# Altium schematic sheet USB.SchDoc
size A4; SheetNumber: 1; SheetTotal: 2
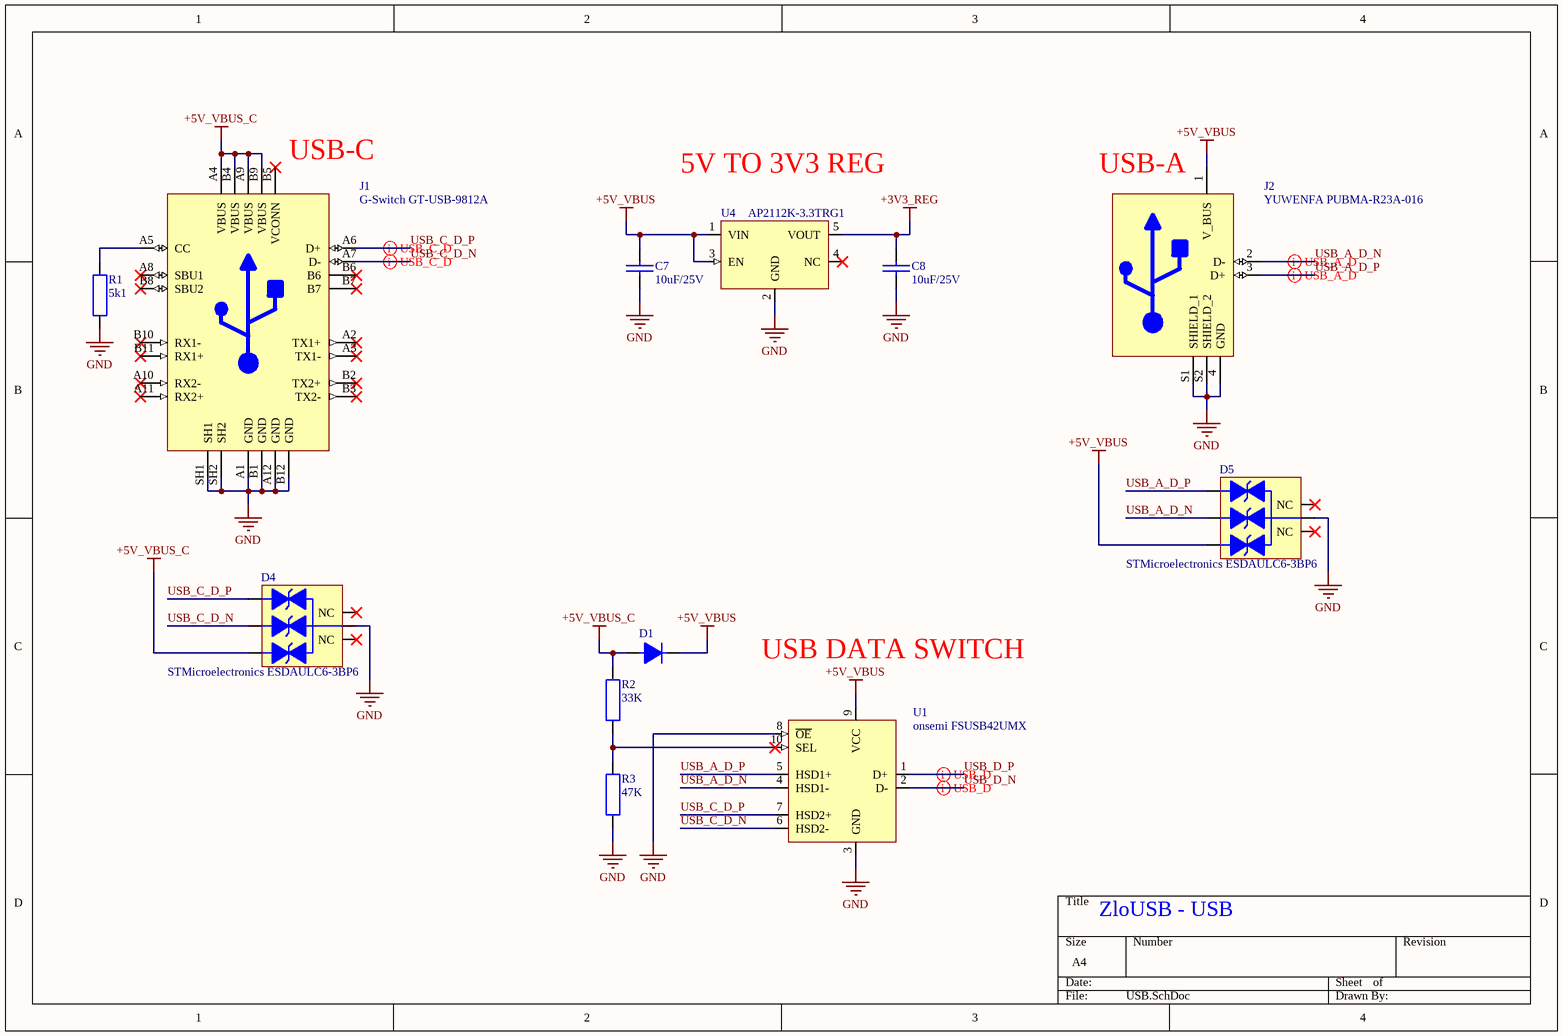
[diagram p0: USB.SchDoc]

## Parts
C7  10uF/25V  [CAPC2012X95N]
C8  10uF/25V  [CAPC2012X95N]
D1  Guangdong Hottech 1N5819WS  [SODFL250130X100N]  (value not drawn)
D4  STMicroelectronics ESDAULC6-3BP6  [STMicroelectronics ESDAULC6-3BP6]
D5  STMicroelectronics ESDAULC6-3BP6  [STMicroelectronics ESDAULC6-3BP6]
J1  G-Switch GT-USB-9812A  [G-Switch GT-USB-9812A]
J2  YUWENFA PUBMA-R23A-016  [YUWENFA PUBMA-R23A-016]
R1  5k1  [RESC1005X40N]
R2  33K  [RESC1005X40N]
R3  47K  [RESC1005X40N]
U1  onsemi FSUSB42UMX  [onsemi FSUSB42UMX]
U4  AP2112K-3.3TRG1  [SOT95P285X140-5N]

## Nets
+3V3_REG: C8.2 U4.5(VOUT)
+5V_VBUS: C7.2 D1.1 D5.4(IO/3) J2.1(V_BUS) U1.9(VCC) U4.1(VIN) U4.3(EN)
+5V_VBUS_C: D1.2 D4.4(IO/3) J1.A4(VBUS) J1.A9(VBUS) J1.B4(VBUS) J1.B9(VBUS) R2.2
GND: C7.1 C8.1 D4.6(GND) D5.6(GND) J1.A1(GND) J1.A12(GND) J1.B1(GND) J1.B12(GND) J1.SH1 J1.SH2 J2.4(GND) J2.S1(SHIELD_1) J2.S2(SHIELD_2) R1.1 R3.1 U1.3(GND) U1.8(~{OE}) U4.2(GND)
USB_A_D_N: D5.3(I/O2) J2.2(D-) U1.4(HSD1-)
USB_A_D_P: D5.1(I/O1) J2.3(D+) U1.5(HSD1+)
USB_C_D_N: D4.3(I/O2) J1.A7(D-) U1.6(HSD2-)
USB_C_D_P: D4.1(I/O1) J1.A6(D+) U1.7(HSD2+)
USB_D_N: U1.2(D-)
USB_D_P: U1.1(D+)
NetJ1_A5: J1.A5(CC) R1.2
NetR2_1: R2.1 R3.2 U1.10(SEL)

Not connected (* = marked no-connect by the designer): D4 2(NC)* 5(NC)*; D5 2(NC)* 5(NC)*; J1 A2(TX1+)* A3(TX1-)* A8(SBU1)* A10(RX2-)* A11(RX2+)* B2(TX2+)* B3(TX2-)* B5(VCONN)* B6* B7* B8(SBU2)* B10(RX1-)* B11(RX1+)*; U4 4(NC)*

## Layout directives
differential pair: USB_A_D_N, USB_A_D_P, USB_C_D_N, USB_C_D_P, USB_D_N, USB_D_P

## Notes on the sheet
- (near J1) USB-C
- 5V TO 3V3 REG
- (near J2) USB-A
- USB DATA SWITCH
- ZloUSB - USB

## Library data of the parts
C7 C8 = Samsung Electro-Mechanics CL21B106KAYQNNE: CAP CER 10uF 25V X7R 0805; Manufacturer Part Number: CL21B106KAYQNNE; ComponentLink1Description: Datasheet; ComponentLink1URL: https://mm.digikey.com/Volume0/opasdata/d220001/medias/docus/7851/1276_CL21B1.pdf; Manufacturer: Samsung Electro-Mechanics; LCSC Part #: C3039694; Supplier 1: LCSC; Supplier Part Number 1: C3039694; JLCPCB Parts Type: Extended; JLCPCB PCBA Type: Economic and Standard
D1 = Guangdong Hottech 1N5819WS: DIODE SCHOTTKY 40V SOD-323; Manufacturer Part Number: 1N5819WS; ComponentLink1Description: Datasheet; ComponentLink1URL: https://www.lcsc.com/datasheet/C191023.pdf?spm=wm.sxq.inf.ggs&lcsc_vid=FgUKAwAHT1hdAgBSEQJZUFZfRwdWX1BXQgcMVwVSEgcxVlNeQ1dbV11VRlhXXzsOAxUeFF5JWBYZEEoKFBINSQcJGk4%3D; Manufacturer: Guangdong Hottech; ComponentLink2Description: 3D Model Source; ComponentLink2URL: *; JLCPCB Parts Type: Basic; JLCPCB PCBA Type: Economic and Standard; Supplier 1: LCSC; Supplier Part Number 1: C191023; LCSC Part #: C191023
D4 D5 = STMicroelectronics ESDAULC6-3BP6: TVS DIODE 5VWM SOT666; Manufacturer Part Number: ESDAULC6-3BP6; ComponentLink1Description: Datasheet; ComponentLink1URL: https://www.st.com/resource/en/datasheet/cd00165276.pdf; Manufacturer: STMicroelectronics; ComponentLink2Description: 3D Model Source; ComponentLink2URL: *; JLCPCB Parts Type: Extended; JLCPCB PCBA Type: Economic and Standard; LCSC Part #: C1976755
J1 = G-Switch GT-USB-9812A: USB 3.1 SMD USB, DVI, HDMI Connector Adapters RoHS; Manufacturer Part Number: GT-USB-9812A; ComponentLink1Description: Datasheet; ComponentLink1URL: https://www.lcsc.com/datasheet/C53055684.pdf?spm=wm.sxq.inf.ggs&lcsc_vid=QFhdBFUAE1JXUFRfFQQLUV0CQlRcUV0CRAJZXwEFRlYxVlNeQ1leUVJRT1lcVTsOAxUeFF5JWBYZEEoKFBINSQcJGk4%3D; Manufacturer: G-Switch; ComponentLink2Description: 3D Model Source; ComponentLink2URL: *; JLCPCB Parts Type: Extended; JLCPCB PCBA Type: Economic and Standard; LCSC Part #: C53055684
J2 = YUWENFA PUBMA-R23A-016: -25℃~+85℃ 0.95mm 1 1,500 Cycles 1.5A 18.8mm 30V 4P Male Recessed Type-A USB 2.0 White With Locating Pins Plugin USB Connectors ROHS; Manufacturer Part Number: PUBMA-R23A-016; ComponentLink1Description: Datasheet; ComponentLink1URL: https://www.lcsc.com/datasheet/C55061488.pdf; Manufacturer: YUWENFA; LCSC Part #: C55061488; ComponentLink2Description: 3D Model Source; ComponentLink2URL: *; JLCPCB Parts Type: Extended; JLCPCB PCBA Type: Economic and Standard
R1 = UNI-ROYAL 0402WGF5101TCE: RES 5.1kΩ ±1% 62.5mW 0402; Manufacturer Part Number: 0402WGF5101TCE; ComponentLink1Description: Datasheet; ComponentLink1URL: https://www.lcsc.com/datasheet/C25905.pdf?spm=wm.sxq.inf.ggs&lcsc_vid=QwRWVlFeFgUPVwAHRlQMVFRWElEIXlYDQFlcUQdRRFYxVlNeRVdaVFZVRFRdXzsOAxUeFF5JWBYZEEoKFBINSQcJGk4%3D; Manufacturer: UNI-ROYAL; ComponentLink2Description: 3D Model Source; ComponentLink2URL: *; JLCPCB Parts Type: Basic; JLCPCB PCBA Type: Economic and Standard; LCSC Part #: C25905
R2 = UNI-ROYAL 0402WGF3302TCE: RES 33kΩ ±1% 62.5mW 0402; Manufacturer Part Number: 0402WGF3302TCE; ComponentLink1Description: Datasheet; ComponentLink1URL: https://www.lcsc.com/datasheet/C25779.pdf?spm=wm.sxq.inf.ggs&lcsc_vid=FgUKAwAHT1hdAgBSEQJZUFZfRwdWX1BXQgcMVwVSEgcxVlNeQ1dbVVBSRVJXVzsOAxUeFF5JWBYZEEoKFBINSQcJGk4%3D; Manufacturer: UNI-ROYAL; ComponentLink2Description: 3D Model Source; ComponentLink2URL: *; JLCPCB Parts Type: Basic; JLCPCB PCBA Type: Economic and Standard; LCSC Part #: C25779
R3 = UNI-ROYAL 0402WGF4702TCE: RES 47kΩ ±1% 62.5mW 0402; Manufacturer Part Number: 0402WGF4702TCE; ComponentLink1Description: Datasheet; ComponentLink1URL: https://www.lcsc.com/datasheet/C25792.pdf?spm=wm.sxq.inf.ggs&lcsc_vid=FgUKAwAHT1hdAgBSEQJZUFZfRwdWX1BXQgcMVwVSEgcxVlNeQ1dbVVFURVhdVTsOAxUeFF5JWBYZEEoKFBINSQcJGk4eFQsCAgIaSgADAwAHC0slRVRZUF1IHxUDCw%3D%3D; Manufacturer: UNI-ROYAL; ComponentLink2Description: 3D Model Source; ComponentLink2URL: *; JLCPCB Parts Type: Basic; JLCPCB PCBA Type: Economic and Standard; LCSC Part #: C25792
U1 = onsemi FSUSB42UMX: IC USB SWITCH DPDT 10UMLP; Manufacturer Part Number: FSUSB42UMX; ComponentLink1Description: Datasheet; ComponentLink1URL: https://www.onsemi.com/pdf/datasheet/fsusb42-d.pdf; Manufacturer: onsemi; ComponentLink2Description: 3D Model Source; ComponentLink2URL: *; JLCPCB Parts Type: Extended; JLCPCB PCBA Type: Economic and Standard; Supplier 1: LCSC; Supplier Part Number 1: C11145; LCSC Part #: C11145
U4 = Diodes Inc. AP2112K-3.3TRG1: IC REG LINEAR 3.3V 600MA SOT-25; Manufacturer: Diodes Incorporated; Manufacturer Part Number: AP2112K-3.3TRG1; ComponentLink1Description: Datasheet; ComponentLink1URL: https://www.diodes.com/assets/Datasheets/AP2112.pdf; LCSC Part #: C51118; Supplier 1: LCSC; Supplier Part Number 1: C51118; JLCPCB Parts Type: Extended; JLCPCB PCBA Type: Economic and Standard